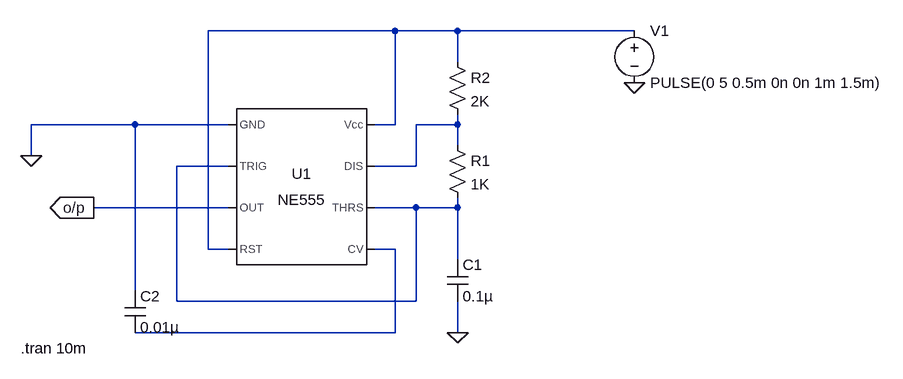
[diagram p0: schematic ic555_1.asc]
ic555_1.asc, the LTspice schematic file:
Version 4.1
SHEET 1 1076 680
WIRE 304 -80 16 -80
WIRE 400 -80 304 -80
WIRE 672 -80 400 -80
WIRE 400 -32 400 -80
WIRE -96 64 -256 64
WIRE 48 64 -96 64
WIRE 304 64 304 -80
WIRE 304 64 272 64
WIRE 400 64 400 48
WIRE 400 64 336 64
WIRE 400 96 400 64
WIRE -256 112 -256 64
WIRE 48 128 -32 128
WIRE 336 128 336 64
WIRE 336 128 272 128
WIRE 48 192 -160 192
WIRE 336 192 272 192
WIRE 400 192 400 176
WIRE 400 192 336 192
WIRE 16 256 16 -80
WIRE 48 256 16 256
WIRE 304 256 272 256
WIRE 400 272 400 192
WIRE -96 320 -96 64
WIRE -32 336 -32 128
WIRE 336 336 336 192
WIRE 336 336 -32 336
WIRE 304 384 304 256
WIRE 304 384 -96 384
WIRE 400 384 400 336
FLAG -256 112 0
FLAG 400 384 0
FLAG 672 0 0
FLAG -160 192 o/p
IOPIN -160 192 Out
SYMBOL Misc\\NE555 160 160 R0
SYMATTR InstName U1
SYMBOL cap 384 272 R0
SYMATTR InstName C1
SYMATTR Value 0.1µ
SYMATTR SpiceLine V=16 Irms=3.85 Rser=0.0464862 Lser=0 mfg="KEMET" pn="C0402C104K4PAC" type="X5R"
SYMBOL res 384 80 R0
SYMATTR InstName R1
SYMATTR Value 1K
SYMATTR SpiceLine tol=1 pwr=0.1
SYMBOL res 384 -48 R0
SYMATTR InstName R2
SYMATTR Value 2K
SYMATTR SpiceLine tol=1 pwr=0.1
SYMBOL voltage 672 -96 R0
WINDOW 123 0 0 Left 0
WINDOW 39 0 0 Left 0
SYMATTR InstName V1
SYMATTR Value PULSE(0 5 0.5m 0n 0n 1m 1.5m)
SYMBOL cap -112 320 R0
SYMATTR InstName C2
SYMATTR Value 0.01µ
SYMATTR SpiceLine V=25 Irms=269m Rser=0.741113 Lser=0 mfg="KEMET" pn="C0402C103K3RAC" type="X7R"
TEXT -272 408 Left 2 !.tran 10m

The netlist it stands for:
* ic555_1.asc
X§U1 0 N003 o/p N001 N004 N003 N002 N001 NE555  ; pins GND TRIG OUT RST CV THRS DIS Vcc
C1 N003 0 0.1µ V=16 Irms=3.85 Rser=0.0464862 Lser=0 mfg="KEMET" pn="C0402C104K4PAC" type="X5R"
R1 N002 N003 1K tol=1 pwr=0.1
R2 N001 N002 2K tol=1 pwr=0.1
V1 N001 0 PULSE(0 5 0.5m 0n 0n 1m 1.5m)
C2 0 N004 0.01µ V=25 Irms=269m Rser=0.741113 Lser=0 mfg="KEMET" pn="C0402C103K3RAC" type="X7R"
.tran 10m
.lib NE555.sub
.backanno
.end